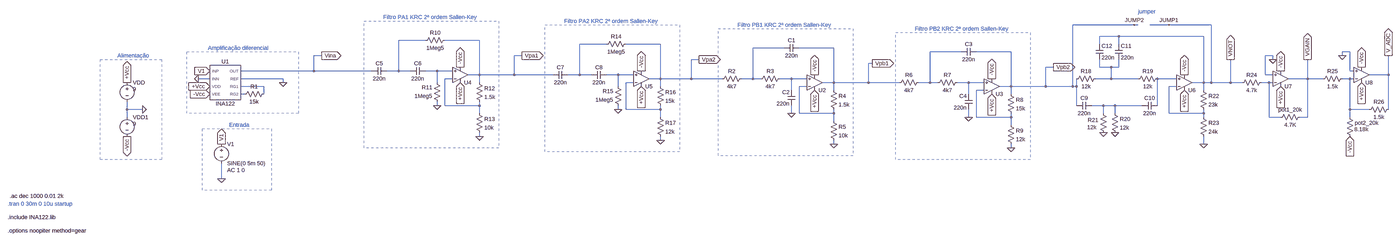
[diagram p0: schematic Esquematico.asc, whole sheet]
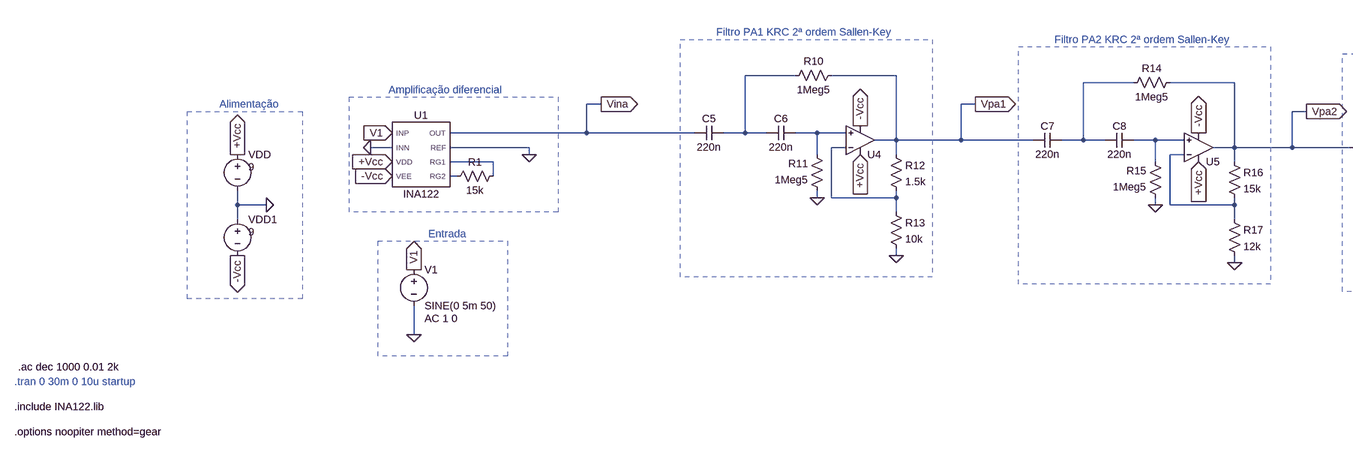
[diagram p1: schematic Esquematico.asc, part, row 1 of 1, column 1 of 2]
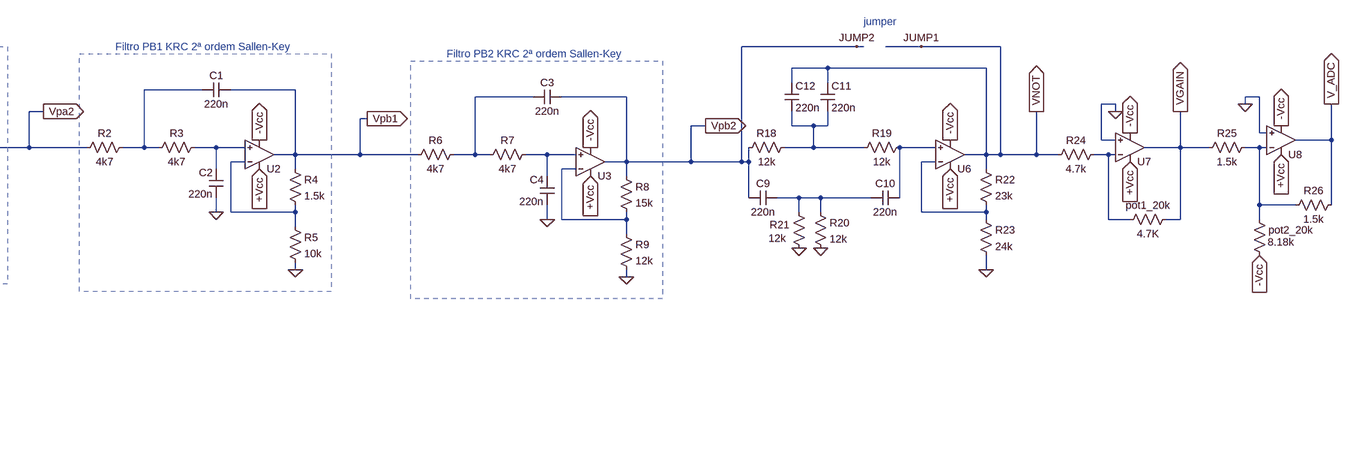
[diagram p2: schematic Esquematico.asc, part, row 1 of 1, column 2 of 2]
Esquematico.asc, the LTspice schematic file:
Version 4.1
SHEET 1 5080 776
WIRE 3952 -96 3696 -96
WIRE 3968 -96 3952 -96
WIRE 4096 -96 4016 -96
WIRE 4272 -96 4096 -96
WIRE 3888 -48 3808 -48
WIRE 4240 -48 3888 -48
WIRE 1008 -32 896 -32
WIRE 1232 -32 1088 -32
WIRE 1760 -16 1648 -16
WIRE 1984 -16 1840 -16
WIRE 3808 -16 3808 -48
WIRE 3888 -16 3888 -48
WIRE 2496 0 2368 0
WIRE 2704 0 2560 0
WIRE 3232 16 3104 16
WIRE 3440 16 3296 16
WIRE 4848 16 4816 16
WIRE 576 32 544 32
WIRE 1408 32 1376 32
WIRE 4528 32 4496 32
WIRE 4816 32 4816 16
WIRE 2144 48 2112 48
WIRE 4528 48 4528 32
WIRE 2864 64 2848 64
WIRE 3616 80 3584 80
WIRE 3808 80 3808 48
WIRE 3856 80 3808 80
WIRE 3888 80 3888 48
WIRE 3888 80 3856 80
WIRE 544 96 544 32
WIRE 544 96 240 96
WIRE 784 96 544 96
WIRE 896 96 896 -32
WIRE 896 96 848 96
WIRE 944 96 896 96
WIRE 1056 96 1008 96
WIRE 1120 96 1056 96
WIRE 4848 96 4848 16
WIRE 4864 96 4848 96
WIRE 1232 112 1232 -32
WIRE 1232 112 1184 112
WIRE 1376 112 1376 32
WIRE 1376 112 1232 112
WIRE 1536 112 1376 112
WIRE 1648 112 1648 -16
WIRE 1648 112 1600 112
WIRE 1696 112 1648 112
WIRE 1808 112 1760 112
WIRE 1872 112 1808 112
WIRE 4496 112 4496 32
WIRE 4528 112 4496 112
WIRE 5008 112 5008 32
WIRE 5008 112 4928 112
WIRE 112 128 64 128
WIRE 416 128 240 128
WIRE 1120 128 1088 128
WIRE 1984 128 1984 -16
WIRE 1984 128 1936 128
WIRE 2112 128 2112 48
WIRE 2112 128 1984 128
WIRE 2240 128 2112 128
WIRE 2368 128 2368 0
WIRE 2368 128 2320 128
WIRE 2400 128 2368 128
WIRE 2528 128 2480 128
WIRE 2592 128 2528 128
WIRE 3856 128 3856 80
WIRE 3856 128 3792 128
WIRE 3968 128 3856 128
WIRE 4128 128 4048 128
WIRE 4672 128 4672 48
WIRE 4672 128 4592 128
WIRE 4736 128 4672 128
WIRE 4848 128 4816 128
WIRE 4864 128 4848 128
WIRE 416 144 416 128
WIRE 1056 144 1056 96
WIRE 1232 144 1232 112
WIRE 1872 144 1840 144
WIRE 2704 144 2704 0
WIRE 2704 144 2656 144
WIRE 2848 144 2848 64
WIRE 2848 144 2704 144
WIRE 2976 144 2848 144
WIRE 3104 144 3104 16
WIRE 3104 144 3056 144
WIRE 3136 144 3104 144
WIRE 3264 144 3216 144
WIRE 3328 144 3264 144
WIRE 4240 144 4240 -48
WIRE 4240 144 4192 144
WIRE 4272 144 4272 -96
WIRE 4272 144 4240 144
WIRE 4352 144 4352 48
WIRE 4352 144 4272 144
WIRE 4400 144 4352 144
WIRE 4512 144 4480 144
WIRE 4528 144 4512 144
WIRE 336 160 240 160
WIRE 1808 160 1808 112
WIRE 1984 160 1984 128
WIRE 2592 160 2560 160
WIRE 3440 160 3440 16
WIRE 3440 160 3392 160
WIRE 3584 160 3584 80
WIRE 3584 160 3440 160
WIRE 3696 160 3696 -96
WIRE 3696 160 3584 160
WIRE 3712 160 3712 128
WIRE 3712 160 3696 160
WIRE 4128 160 4096 160
WIRE 2528 176 2528 128
WIRE 2704 176 2704 144
WIRE 3328 176 3296 176
WIRE 4240 176 4240 144
WIRE 256 192 240 192
WIRE 336 192 336 160
WIRE 3264 192 3264 144
WIRE 3440 192 3440 160
WIRE 1056 240 1056 224
WIRE 1088 240 1088 128
WIRE 1232 240 1232 224
WIRE 1232 240 1088 240
WIRE 3712 240 3712 160
WIRE 3824 240 3776 240
WIRE 3872 240 3824 240
WIRE 3984 240 3872 240
WIRE 4048 240 4048 128
WIRE -272 256 -272 224
WIRE -208 256 -272 256
WIRE 1808 256 1808 240
WIRE 1840 256 1840 144
WIRE 1984 256 1984 240
WIRE 1984 256 1840 256
WIRE 4848 256 4848 128
WIRE 4928 256 4848 256
WIRE 5008 256 5008 112
WIRE 1232 272 1232 240
WIRE 2528 272 2528 240
WIRE 2560 272 2560 160
WIRE 2704 272 2704 256
WIRE 2704 272 2560 272
WIRE 3824 272 3824 240
WIRE 3872 272 3872 240
WIRE 4096 272 4096 160
WIRE 4240 272 4240 256
WIRE 4240 272 4096 272
WIRE -272 288 -272 256
WIRE 1984 288 1984 256
WIRE 3264 288 3264 256
WIRE 3296 288 3296 176
WIRE 3440 288 3440 272
WIRE 3440 288 3296 288
WIRE 4240 288 4240 272
WIRE 4512 288 4512 144
WIRE 4560 288 4512 288
WIRE 4672 288 4672 128
WIRE 4672 288 4640 288
WIRE 4848 288 4848 256
WIRE 2704 304 2704 272
WIRE 3440 320 3440 288
WIRE 1232 368 1232 352
WIRE 1984 384 1984 368
WIRE 2704 400 2704 384
WIRE 4240 400 4240 368
WIRE 3440 416 3440 400
WIRE 160 544 160 480
FLAG 160 544 0
FLAG 112 96 V1
IOPIN 112 96 In
FLAG -208 256 0
FLAG 112 192 -Vcc
IOPIN 112 192 In
FLAG -272 144 +Vcc
IOPIN -272 144 Out
FLAG 160 400 V1
IOPIN 160 400 Out
FLAG -272 368 -Vcc
IOPIN -272 368 Out
FLAG 64 128 0
FLAG 416 144 0
FLAG 576 32 Vina
IOPIN 576 32 Out
FLAG 2528 272 0
FLAG 2704 400 0
FLAG 2624 176 +Vcc
IOPIN 2624 176 In
FLAG 2624 112 -Vcc
IOPIN 2624 112 Out
FLAG 2864 64 Vpb1
IOPIN 2864 64 Out
FLAG 3264 288 0
FLAG 3440 416 0
FLAG 3360 192 +Vcc
IOPIN 3360 192 In
FLAG 3360 128 -Vcc
IOPIN 3360 128 Out
FLAG 3616 80 Vpb2
IOPIN 3616 80 Out
FLAG 1056 240 0
FLAG 1232 368 0
FLAG 1152 144 +Vcc
IOPIN 1152 144 In
FLAG 1152 80 -Vcc
IOPIN 1152 80 Out
FLAG 1408 32 Vpa1
IOPIN 1408 32 Out
FLAG 1808 256 0
FLAG 1984 384 0
FLAG 1904 160 +Vcc
IOPIN 1904 160 In
FLAG 1904 96 -Vcc
IOPIN 1904 96 Out
FLAG 2144 48 Vpa2
IOPIN 2144 48 Out
FLAG 3872 352 0
FLAG 3824 352 0
FLAG 4240 400 0
FLAG 4160 112 -Vcc
IOPIN 4160 112 Out
FLAG 4160 176 +Vcc
IOPIN 4160 176 In
FLAG 4528 48 0
FLAG 4560 96 -Vcc
IOPIN 4560 96 Out
FLAG 4560 160 +Vcc
IOPIN 4560 160 In
FLAG 4848 368 -Vcc
IOPIN 4848 368 In
FLAG 4896 144 +Vcc
IOPIN 4896 144 In
FLAG 4896 80 -Vcc
IOPIN 4896 80 Out
FLAG 4816 32 0
FLAG 4096 -96 JUMP1
FLAG 3952 -96 JUMP2
FLAG 4352 48 VNOT
IOPIN 4352 48 Out
FLAG 4672 48 VGAIN
IOPIN 4672 48 Out
FLAG 5008 32 V_ADC
IOPIN 5008 32 Out
FLAG 112 160 +Vcc
IOPIN 112 160 In
SYMBOL INA122 176 144 R0
SYMATTR InstName U1
SYMBOL voltage 160 384 R0
WINDOW 123 24 124 Left 2
WINDOW 39 0 0 Left 0
SYMATTR Value2 AC 1 0
SYMATTR InstName V1
SYMATTR Value SINE(0 5m 50)
SYMBOL voltage -272 128 R0
WINDOW 3 24 44 Left 2
WINDOW 123 0 0 Left 0
WINDOW 39 0 0 Left 0
SYMATTR Value 9
SYMATTR InstName VDD
SYMBOL res 352 176 R90
WINDOW 0 0 56 VBottom 2
WINDOW 3 32 56 VTop 2
SYMATTR InstName R1
SYMATTR Value 15k
SYMBOL voltage -272 272 R0
WINDOW 3 24 44 Left 2
WINDOW 123 0 0 Left 0
WINDOW 39 0 0 Left 0
SYMATTR Value 9
SYMATTR InstName VDD1
SYMBOL res 2336 112 R90
WINDOW 0 0 56 VBottom 2
WINDOW 3 32 56 VTop 2
SYMATTR InstName R2
SYMATTR Value 4k7
SYMBOL res 2496 112 R90
WINDOW 0 0 56 VBottom 2
WINDOW 3 32 56 VTop 2
SYMATTR InstName R3
SYMATTR Value 4k7
SYMBOL cap 2560 -16 R90
WINDOW 0 0 32 VBottom 2
WINDOW 3 32 32 VTop 2
SYMATTR InstName C1
SYMATTR Value 220n
SYMBOL OpAmps\\UniversalOpAmp2 2624 144 M180
SYMATTR InstName U2
SYMATTR Value2 Avol=1Meg GBW=500k Slew=160k
SYMATTR SpiceLine Ilimit=25m Rail=0 Vos=250u
SYMATTR SpiceLine2 En=0 Enk=0 In=0 Ink=0 Rin=10G
SYMBOL cap 2544 240 R180
WINDOW 0 24 56 Left 2
WINDOW 3 24 8 Left 2
SYMATTR InstName C2
SYMATTR Value 220n
SYMBOL res 2688 160 R0
SYMATTR InstName R4
SYMATTR Value 1.5k
SYMBOL res 2688 288 R0
SYMATTR InstName R5
SYMATTR Value 10k
SYMBOL res 3072 128 R90
WINDOW 0 0 56 VBottom 2
WINDOW 3 32 56 VTop 2
SYMATTR InstName R6
SYMATTR Value 4k7
SYMBOL res 3232 128 R90
WINDOW 0 0 56 VBottom 2
WINDOW 3 32 56 VTop 2
SYMATTR InstName R7
SYMATTR Value 4k7
SYMBOL cap 3296 0 R90
WINDOW 0 0 32 VBottom 2
WINDOW 3 32 32 VTop 2
SYMATTR InstName C3
SYMATTR Value 220n
SYMBOL OpAmps\\UniversalOpAmp2 3360 160 M180
SYMATTR InstName U3
SYMATTR Value2 Avol=1Meg GBW=500k Slew=160k
SYMATTR SpiceLine Ilimit=25m Rail=0 Vos=250u
SYMATTR SpiceLine2 En=0 Enk=0 In=0 Ink=0 Rin=10G
SYMBOL cap 3280 256 R180
WINDOW 0 24 56 Left 2
WINDOW 3 24 8 Left 2
SYMATTR InstName C4
SYMATTR Value 220n
SYMBOL res 3424 176 R0
SYMATTR InstName R8
SYMATTR Value 15k
SYMBOL res 3424 304 R0
SYMATTR InstName R9
SYMATTR Value 12k
SYMBOL res 1104 -48 R90
WINDOW 0 0 56 VBottom 2
WINDOW 3 32 56 VTop 2
SYMATTR InstName R10
SYMATTR Value 1Meg5
SYMBOL res 1072 240 R180
WINDOW 0 36 76 Left 2
WINDOW 3 36 40 Left 2
SYMATTR InstName R11
SYMATTR Value 1Meg5
SYMBOL cap 848 80 R90
WINDOW 0 0 32 VBottom 2
WINDOW 3 32 32 VTop 2
SYMATTR InstName C5
SYMATTR Value 220n
SYMBOL OpAmps\\UniversalOpAmp2 1152 112 M180
SYMATTR InstName U4
SYMATTR Value2 Avol=1Meg GBW=500k Slew=160k
SYMATTR SpiceLine Ilimit=25m Rail=0 Vos=250u
SYMATTR SpiceLine2 En=0 Enk=0 In=0 Ink=0 Rin=10G
SYMBOL cap 944 112 R270
WINDOW 0 32 32 VTop 2
WINDOW 3 0 32 VBottom 2
SYMATTR InstName C6
SYMATTR Value 220n
SYMBOL res 1216 128 R0
SYMATTR InstName R12
SYMATTR Value 1.5k
SYMBOL res 1216 256 R0
SYMATTR InstName R13
SYMATTR Value 10k
SYMBOL res 1856 -32 R90
WINDOW 0 0 56 VBottom 2
WINDOW 3 32 56 VTop 2
SYMATTR InstName R14
SYMATTR Value 1Meg5
SYMBOL res 1824 256 R180
WINDOW 0 36 76 Left 2
WINDOW 3 36 40 Left 2
SYMATTR InstName R15
SYMATTR Value 1Meg5
SYMBOL cap 1600 96 R90
WINDOW 0 0 32 VBottom 2
WINDOW 3 32 32 VTop 2
SYMATTR InstName C7
SYMATTR Value 220n
SYMBOL OpAmps\\UniversalOpAmp2 1904 128 M180
SYMATTR InstName U5
SYMATTR Value2 Avol=1Meg GBW=500k Slew=160k
SYMATTR SpiceLine Ilimit=25m Rail=0 Vos=250u
SYMATTR SpiceLine2 En=0 Enk=0 In=0 Ink=0 Rin=10G
SYMBOL cap 1696 128 R270
WINDOW 0 32 32 VTop 2
WINDOW 3 0 32 VBottom 2
SYMATTR InstName C8
SYMATTR Value 220n
SYMBOL res 1968 144 R0
SYMATTR InstName R16
SYMATTR Value 15k
SYMBOL res 1968 272 R0
SYMATTR InstName R17
SYMATTR Value 12k
SYMBOL OpAmps\\UniversalOpAmp2 4160 144 M180
SYMATTR InstName U6
SYMATTR Value2 Avol=1Meg GBW=500k Slew=160k
SYMATTR SpiceLine Ilimit=25m Rail=0 Vos=250u
SYMATTR SpiceLine2 En=0 Enk=0 In=0 Ink=0 Rin=10G
SYMBOL res 3808 112 R90
WINDOW 0 0 56 VBottom 2
WINDOW 3 32 56 VTop 2
SYMATTR InstName R18
SYMATTR Value 12k
SYMBOL cap 3776 224 R90
WINDOW 0 0 32 VBottom 2
WINDOW 3 32 32 VTop 2
SYMATTR InstName C9
SYMATTR Value 220n
SYMBOL res 4064 112 R90
WINDOW 0 0 56 VBottom 2
WINDOW 3 32 56 VTop 2
SYMATTR InstName R19
SYMATTR Value 12k
SYMBOL cap 4048 224 R90
WINDOW 0 0 32 VBottom 2
WINDOW 3 32 32 VTop 2
SYMATTR InstName C10
SYMATTR Value 220n
SYMBOL cap 3872 -16 R0
SYMATTR InstName C11
SYMATTR Value 220n
SYMBOL cap 3792 -16 R0
SYMATTR InstName C12
SYMATTR Value 220n
SYMBOL res 3856 256 R0
SYMATTR InstName R20
SYMATTR Value 12k
SYMBOL res 3808 256 R0
WINDOW 0 -49 44 Left 2
WINDOW 3 -52 74 Left 2
SYMATTR InstName R21
SYMATTR Value 12k
SYMBOL res 4224 160 R0
SYMATTR InstName R22
SYMATTR Value 23k
SYMBOL res 4224 272 R0
SYMATTR InstName R23
SYMATTR Value 24k
SYMBOL res 4496 128 R90
WINDOW 0 0 56 VBottom 2
WINDOW 3 32 56 VTop 2
SYMATTR InstName R24
SYMATTR Value 4.7k
SYMBOL OpAmps\\UniversalOpAmp2 4560 128 M180
SYMATTR InstName U7
SYMATTR Value2 Avol=1Meg GBW=500k Slew=160k
SYMATTR SpiceLine Ilimit=25m Rail=0 Vos=250u
SYMATTR SpiceLine2 En=0 Enk=0 In=0 Ink=0 Rin=10G
SYMBOL res 4656 272 R90
WINDOW 0 0 56 VBottom 2
WINDOW 3 32 56 VTop 2
SYMATTR InstName pot1_20k
SYMATTR Value 4.7K
SYMBOL res 4832 112 R90
WINDOW 0 0 56 VBottom 2
WINDOW 3 32 56 VTop 2
SYMATTR InstName R25
SYMATTR Value 1.5k
SYMBOL OpAmps\\UniversalOpAmp2 4896 112 M180
SYMATTR InstName U8
SYMATTR Value2 Avol=1Meg GBW=500k Slew=160k
SYMATTR SpiceLine Ilimit=25m Rail=0 Vos=250u
SYMATTR SpiceLine2 En=0 Enk=0 In=0 Ink=0 Rin=10G
SYMBOL res 4832 272 R0
WINDOW 3 34 66 Left 2
SYMATTR Value 8.18k
SYMATTR InstName pot2_20k
SYMBOL res 5024 240 R90
WINDOW 0 0 56 VBottom 2
WINDOW 3 32 56 VTop 2
SYMATTR InstName R26
SYMATTR Value 1.5k
TEXT -768 648 Left 2 ;.tran 0 30m 0 10u startup
TEXT -768 704 Left 2 !.include INA122.lib
TEXT -768 760 Left 2 !.options noopiter method=gear
TEXT -312 32 Left 2 ;Alimentação
TEXT 192 320 Left 2 ;Entrada
TEXT 104 0 Left 2 ;Amplificação diferencial
TEXT 2304 -96 Left 2 ;Filtro PB1 KRC 2ª ordem Sallen-Key
TEXT 3040 -80 Left 2 ;Filtro PB2 KRC 2ª ordem Sallen-Key
TEXT 832 -128 Left 2 ;Filtro PA1 KRC 2ª ordem Sallen-Key
TEXT 1584 -112 Left 2 ;Filtro PA2 KRC 2ª ordem Sallen-Key
TEXT 3968 -152 Left 2 ;jumper
TEXT -760 616 Left 2 !.ac dec 1000 0.01 2k
RECTANGLE Normal -128 464 -384 48 2
RECTANGLE Normal 480 272 16 16 2
RECTANGLE Normal 368 592 80 336 2
RECTANGLE Normal 2784 448 2224 -80 2
RECTANGLE Normal 3520 464 2960 -64 2
RECTANGLE Normal 1312 416 752 -112 2
RECTANGLE Normal 2064 432 1504 -96 2

The netlist it stands for:
* Esquematico.asc
X§U1 V1 0 +Vcc -Vcc Vina 0 N015 N019 INA122  ; pins INP INN VDD VEE OUT REF RG1 RG2
V1 V1 0 SINE(0 5m 50) AC 1 0
VDD +Vcc 0 9
R1 N015 N019 15k
VDD1 0 -Vcc 9
R2 N003 Vpa2 4k7
R3 N009 N003 4k7
C1 Vpb1 N003 220n
X§U2 N009 N016 +Vcc -Vcc Vpb1 level2 Avol=1Meg GBW=500k Slew=160k Ilimit=25m Rail=0 Vos=250u En=0 Enk=0 In=0 Ink=0 Rin=10G  ; pins In+ In- V+ V- OUT
C2 0 N009 220n
R4 Vpb1 N016 1.5k
R5 N016 0 10k
R6 N004 Vpb1 4k7
R7 N013 N004 4k7
C3 JUMP2 N004 220n
X§U3 N013 N018 +Vcc -Vcc JUMP2 level2 Avol=1Meg GBW=500k Slew=160k Ilimit=25m Rail=0 Vos=250u En=0 Enk=0 In=0 Ink=0 Rin=10G  ; pins In+ In- V+ V- OUT
C4 0 N013 220n
R8 JUMP2 N018 15k
R9 N018 0 12k
R10 Vpa1 N001 1Meg5
R11 0 N006 1Meg5
C5 N001 Vina 220n
X§U4 N006 N008 +Vcc -Vcc Vpa1 level2 Avol=1Meg GBW=500k Slew=160k Ilimit=25m Rail=0 Vos=250u En=0 Enk=0 In=0 Ink=0 Rin=10G  ; pins In+ In- V+ V- OUT
C6 N001 N006 220n
R12 Vpa1 N008 1.5k
R13 N008 0 10k
R14 Vpa2 N002 1Meg5
R15 0 N007 1Meg5
C7 N002 Vpa1 220n
X§U5 N007 N012 +Vcc -Vcc Vpa2 level2 Avol=1Meg GBW=500k Slew=160k Ilimit=25m Rail=0 Vos=250u En=0 Enk=0 In=0 Ink=0 Rin=10G  ; pins In+ In- V+ V- OUT
C8 N002 N007 220n
R16 Vpa2 N012 15k
R17 N012 0 12k
X§U6 N010 N017 +Vcc -Vcc VNOT level2 Avol=1Meg GBW=500k Slew=160k Ilimit=25m Rail=0 Vos=250u En=0 Enk=0 In=0 Ink=0 Rin=10G  ; pins In+ In- V+ V- OUT
R18 N005 JUMP2 12k
C9 N020 JUMP2 220n
R19 N010 N005 12k
C10 N010 N020 220n
C11 VNOT N005 220n
C12 VNOT N005 220n
R20 N020 0 12k
R21 N020 0 12k
R22 VNOT N017 23k
R23 N017 0 24k
R24 N014 VNOT 4.7k
X§U7 0 N014 +Vcc -Vcc VGAIN level2 Avol=1Meg GBW=500k Slew=160k Ilimit=25m Rail=0 Vos=250u En=0 Enk=0 In=0 Ink=0 Rin=10G  ; pins In+ In- V+ V- OUT
R§pot1_20k VGAIN N014 4.7K
R25 N011 VGAIN 1.5k
X§U8 0 N011 +Vcc -Vcc V_ADC level2 Avol=1Meg GBW=500k Slew=160k Ilimit=25m Rail=0 Vos=250u En=0 Enk=0 In=0 Ink=0 Rin=10G  ; pins In+ In- V+ V- OUT
R§pot2_20k N011 -Vcc 8.18k
R26 V_ADC N011 1.5k
* .tran 0 30m 0 10u startup
.include INA122.lib
.options noopiter method=gear
* Alimentação
* Entrada
* Amplificação diferencial
* Filtro PB1 KRC 2ª ordem Sallen-Key
* Filtro PB2 KRC 2ª ordem Sallen-Key
* Filtro PA1 KRC 2ª ordem Sallen-Key
* Filtro PA2 KRC 2ª ordem Sallen-Key
* jumper
.ac dec 1000 0.01 2k
.lib UniversalOpAmp2.lib
.backanno
.end